# Altium schematic sheet Schematic.SchDoc
size A4; SheetNumber: 1; SheetTotal: 1
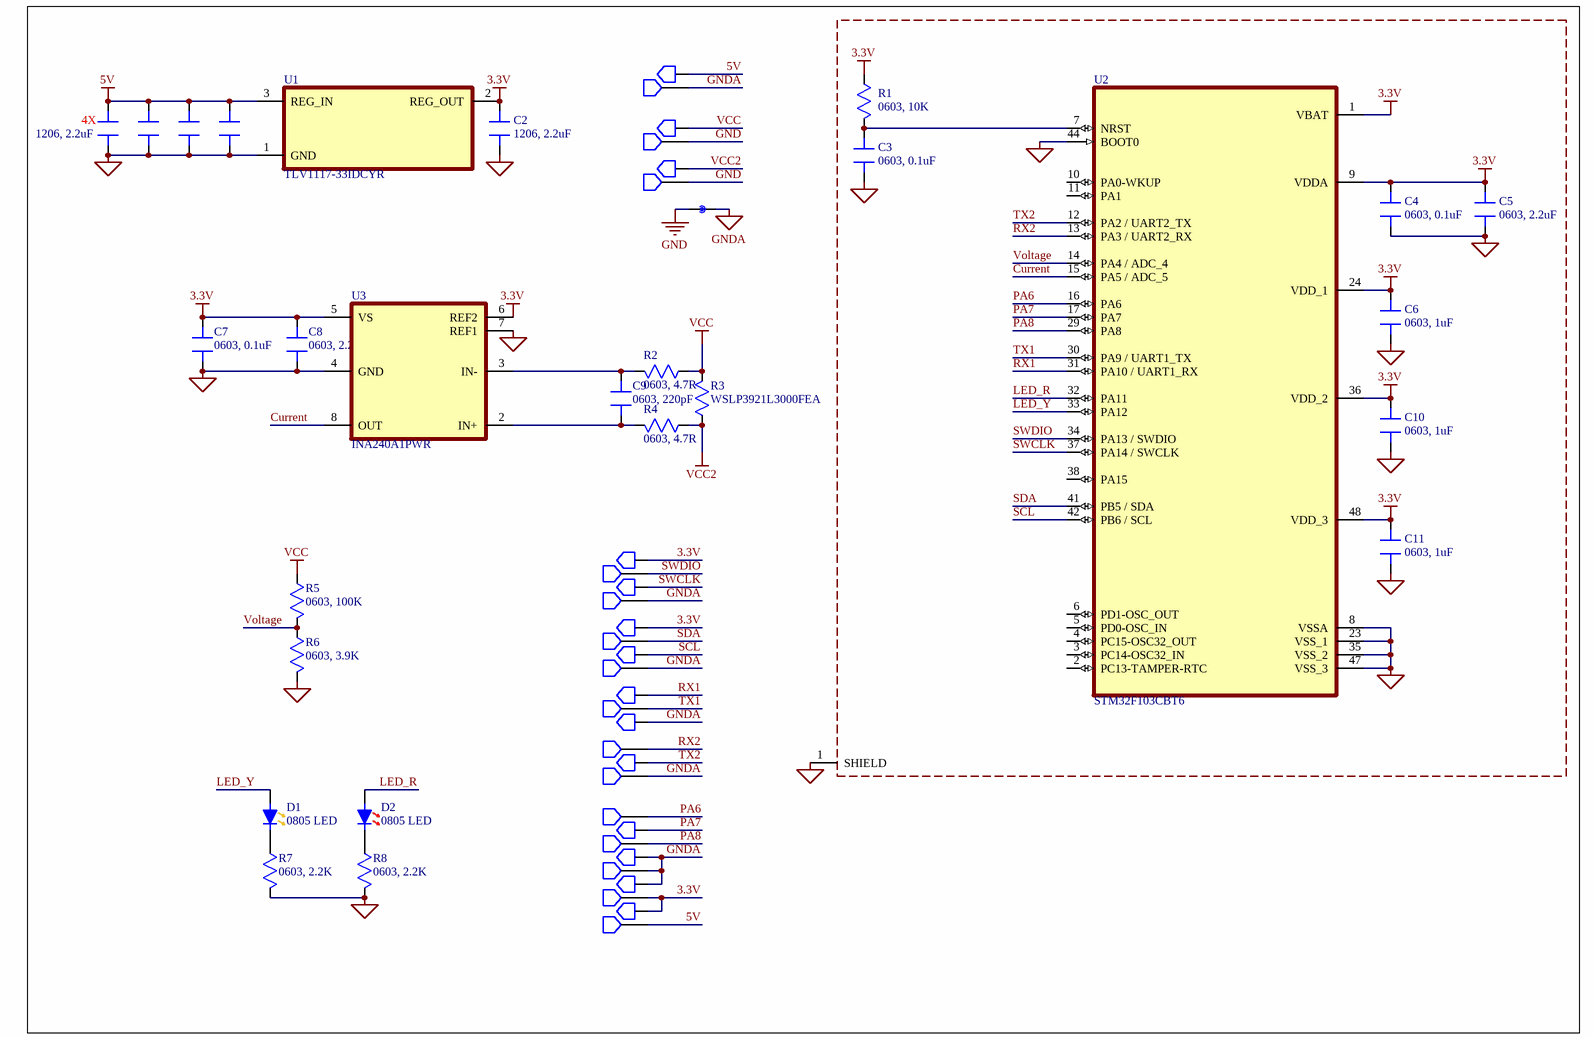
[diagram p0: Schematic.SchDoc]

## Parts
C1  1206, 2.2uF  [CAP 1206_3216]  (value not drawn)
C2  1206, 2.2uF  [CAP 1206_3216]
C3  0603, 0.1uF  [CAP 0603_1608]
C4  0603, 0.1uF  [CAP 0603_1608]
C5  0603, 2.2uF  [CAP 0603_1608]
C6  0603, 1uF  [CAP 0603_1608]
C7  0603, 0.1uF  [CAP 0603_1608]
C8  0603, 2.22uF  [CAP 0603_1608]
C9  0603, 220pF  [CAP 0603_1608]
C10  0603, 1uF  [CAP 0603_1608]
C11  0603, 1uF  [CAP 0603_1608]
C12  1206, 2.2uF  [CAP 1206_3216]
C13  1206, 2.2uF  [CAP 1206_3216]  (value not drawn)
C14  1206, 2.2uF  [CAP 1206_3216]  (value not drawn)
D1  0805 LED  [LED 0805_2012 YELLOW]
D2  0805 LED  [LED 0805_2012 RED]
N1  NetTie  [NETTİE]  (value not drawn)  (no BOM)
P1  Pad0  [PAD]  (value not drawn)  (no BOM)
P2  Pad1  [PAD]  (value not drawn)  (no BOM)
P3  Pad0  [PAD]  (value not drawn)  (no BOM)
P4  Pad1  [PAD]  (value not drawn)  (no BOM)
P5  Pad0  [PAD]  (value not drawn)  (no BOM)
P6  Pad1  [PAD]  (value not drawn)  (no BOM)
P7  Pad0  [PAD]  (value not drawn)  (no BOM)
P8  Pad1  [PAD]  (value not drawn)  (no BOM)
P9  Pad0  [PAD]  (value not drawn)  (no BOM)
P10  Pad1  [PAD]  (value not drawn)  (no BOM)
P11  Pad0  [PAD]  (value not drawn)  (no BOM)
P12  Pad1  [PAD]  (value not drawn)  (no BOM)
P13  Pad0  [PAD]  (value not drawn)  (no BOM)
P14  Pad1  [PAD]  (value not drawn)  (no BOM)
P15  Pad0  [PAD]  (value not drawn)  (no BOM)
P16  Pad1  [PAD]  (value not drawn)  (no BOM)
P17  Pad0  [PAD]  (value not drawn)  (no BOM)
P18  Pad1  [PAD]  (value not drawn)  (no BOM)
P19  Pad0  [PAD]  (value not drawn)  (no BOM)
P20  Pad1  [PAD]  (value not drawn)  (no BOM)
P21  Pad1  [PAD]  (value not drawn)  (no BOM)
P22  Pad0  [PAD]  (value not drawn)  (no BOM)
P23  Pad1  [PAD]  (value not drawn)  (no BOM)
P24  Pad0  [PAD]  (value not drawn)  (no BOM)
P25  Pad1  [PAD]  (value not drawn)  (no BOM)
P26  Pad0  [PAD]  (value not drawn)  (no BOM)
P27  Pad1  [PAD]  (value not drawn)  (no BOM)
P28  Pad0  [PAD]  (value not drawn)  (no BOM)
P29  Pad1  [PAD]  (value not drawn)  (no BOM)
R1  0603, 10K  [RES 0603_1608]
R2  0603, 4.7R  [RES 0603_1608]
R3  WSLP3921L3000FEA  [WSLP3921L3000FEA]
R4  0603, 4.7R  [RES 0603_1608]
R5  0603, 100K  [RES 0603_1608]
R6  0603, 3.9K  [RES 0603_1608]
R7  0603, 2.2K  [RES 0603_1608]
R8  0603, 2.2K  [RES 0603_1608]
U1  TLV1117-33IDCYR  [SOT230P700X180-4N]
U2  STM32F103CBT6  [QFP50P900X900X160-48N]
U3  INA240A1PWR  [INA240A1PWR]
U4  36503205S  [36503205S]  (value not drawn)

## Nets
3.3V: C2.2 C4.1 C5.1 C6.1 C7.1 C8.1 C10.1 C11.1 P7.1 P11.1 P27.1 P28.1 R1.2 U1.2(REG_OUT) U2.1(VBAT) U2.9(VDDA) U2.24(VDD_1) U2.36(VDD_2) U2.48(VDD_3) U3.5(VS) U3.6(REF2)
5V: C1.2 C12.2 C13.2 C14.2 P1.1 P29.1 U1.3(REG_IN)
GND: N1.0 P4.1 P6.1
GNDA: C1.1 C2.1 C3.2 C4.2 C5.2 C6.2 C7.2 C8.2 C10.2 C11.2 C12.1 C13.1 C14.1 N1.1 P2.1 P10.1 P14.1 P17.1 P20.1 P24.1 P25.1 P26.1 R6.2 R7.2 R8.2 U1.1(GND) U2.8(VSSA) U2.23(VSS_1) U2.35(VSS_2) U2.44(BOOT0) U2.47(VSS_3) U3.4(GND) U3.7(REF1) U4.1(SHIELD)
VCC: P3.1 R2.1 R3.2 R5.1
VCC2: P5.1 R3.1 R4.1
Current: U2.15(PA5_/_ADC_5) U3.8(OUT)
LED_R: D2.1 U2.32(PA11)
LED_Y: D1.1 U2.33(PA12)
PA6: P21.1 U2.16(PA6)
PA7: P22.1 U2.17(PA7)
PA8: P23.1 U2.29(PA8)
RX1: P15.1 U2.31(PA10_/_UART1_RX)
RX2: P18.1 U2.13(PA3_/_UART2_RX)
SCL: P13.1 U2.42(PB6_/_SCL)
SDA: P12.1 U2.41(PB5_/_SDA)
SWCLK: P9.1 U2.37(PA14_/_SWCLK)
SWDIO: P8.1 U2.34(PA13_/_SWDIO)
TX1: P16.1 U2.30(PA9_/_UART1_TX)
TX2: P19.1 U2.12(PA2_/_UART2_TX)
Voltage: R5.2 R6.1 U2.14(PA4_/_ADC_4)
NetC3_1: C3.1 R1.1 U2.7(NRST)
NetC9_1: C9.1 R2.2 U3.3(IN-)
NetC9_2: C9.2 R4.2 U3.2(IN+)
NetD1_2: D1.2 R7.1
NetD2_2: D2.2 R8.1

Not connected (* = marked no-connect by the designer): U2 2(PC13-TAMPER-RTC) 3(PC14-OSC32_IN) 4(PC15-OSC32_OUT) 5(PD0-OSC_IN) 6(PD1-OSC_OUT) 10(PA0-WKUP) 11(PA1) 38(PA15)

## Notes on the sheet
- (near C12) 4X

## Library data of the parts
C1 C2 C12-C14 = 1206 Kapasitör: Voltage Rating: 100V
C3 = 0603 Kapasitör: Voltage Rating: 100V
C4-C11 = 0603 Kapasitör
D1 = 0805 LED Yellow
D2 = 0805 LED Red
R1 R2 R4-R8 = 0603 Direnç
U2 = STM32F103CBT6: ARMÂ® CortexÂ®-M3 STM32F1 Microcontroller IC 32-Bit Single-Core 72MHz 128KB (128K x 8) FLASH; MF: STMicroelectronics; SnapEDA_Link: https://www.snapeda.com/parts/STM32F103CBT6/STMicroelectronics/view-part/?ref=snap; Package: LQFP-48 STMicroelectronics; Value: *; MP: STM32F103CBT6; Check_prices: https://www.snapeda.com/parts/STM32F103CBT6/STMicroelectronics/view-part/?ref=eda
U4 = 36503205S: Manufacturer_Name: Wurth Elektronik; Geometry.Height: 3mm; Manufacturer_Part_Number: 36503205S; Mouser Part Number: 710-36503205S; Mouser Price/Stock: https://www.mouser.co.uk/ProductDetail/Wurth-Elektronik/36503205S?qs=f9yNj16SXrI2DSLNsc02Mg%3D%3D; Arrow Part Number: *; Arrow Price/Stock: *; Datasheet Link: https://www.we-online.com/catalog/datasheet/36503205S.pdf